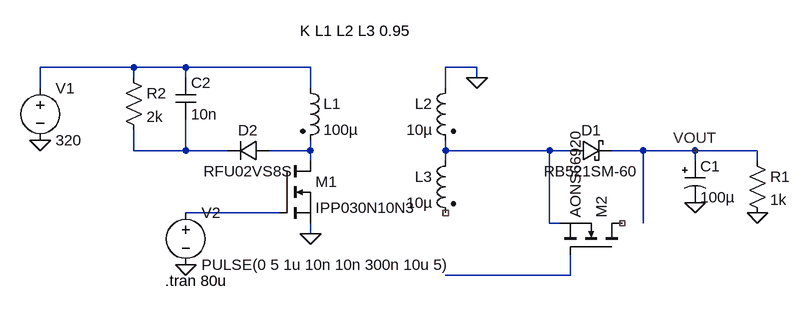
[diagram p0: schematic flyback_secondary_transistor.asc]
flyback_secondary_transistor.asc, the LTspice schematic file:
Version 4
SHEET 1 952 680
WIRE -64 96 -208 96
WIRE 16 96 -64 96
WIRE 208 96 16 96
WIRE 464 96 416 96
WIRE -64 112 -64 96
WIRE 16 112 16 96
WIRE 464 112 464 96
WIRE -208 128 -208 96
WIRE 208 128 208 96
WIRE 416 128 416 96
WIRE -64 224 -64 192
WIRE 16 224 16 176
WIRE 16 224 -64 224
WIRE 80 224 16 224
WIRE 208 224 208 208
WIRE 208 224 144 224
WIRE 416 224 416 208
WIRE 576 224 416 224
WIRE 608 224 576 224
WIRE 720 224 672 224
WIRE 800 224 720 224
WIRE 896 224 800 224
WIRE 208 240 208 224
WIRE 416 240 416 224
WIRE 800 240 800 224
WIRE 896 240 896 224
WIRE 160 320 16 320
WIRE 576 336 576 224
WIRE 592 336 576 336
WIRE 720 336 720 224
WIRE 208 352 208 336
WIRE 608 416 608 384
WIRE 608 416 416 416
FLAG -208 208 0
FLAG 208 352 0
FLAG 16 400 0
FLAG 464 112 0
FLAG 800 304 0
FLAG 800 224 VOUT
FLAG 896 320 0
SYMBOL ind2 192 112 R0
SYMATTR InstName L1
SYMATTR Value 100µ
SYMATTR Type ind
SYMATTR SpiceLine Rser=3
SYMBOL ind2 432 112 M0
SYMATTR InstName L2
SYMATTR Value 10µ
SYMATTR Type ind
SYMATTR SpiceLine Rser=0.1
SYMBOL ind2 432 224 M0
SYMATTR InstName L3
SYMATTR Value 10µ
SYMATTR Type ind
SYMATTR SpiceLine Rser=0.1
SYMBOL voltage -208 112 R0
WINDOW 123 0 0 Left 0
WINDOW 39 0 0 Left 0
SYMATTR InstName V1
SYMATTR Value 320
SYMBOL nmos 160 240 R0
SYMATTR InstName M1
SYMATTR Value IPP030N10N3
SYMBOL voltage 16 304 R0
WINDOW 123 0 0 Left 0
WINDOW 39 0 0 Left 0
SYMATTR InstName V2
SYMATTR Value PULSE(0 5 1u 10n 10n 300n 10u 5)
SYMBOL schottky 608 240 R270
WINDOW 0 32 32 VTop 2
WINDOW 3 0 32 VBottom 2
SYMATTR InstName D1
SYMATTR Value RB521SM-60
SYMATTR Description Diode
SYMATTR Type diode
SYMBOL nmos 688 384 M270
SYMATTR InstName M2
SYMATTR Value AONS66920
SYMBOL polcap 784 240 R0
WINDOW 3 24 56 Left 2
SYMATTR Value 100µ
SYMATTR InstName C1
SYMATTR Description Capacitor
SYMATTR Type cap
SYMATTR SpiceLine V=63 Irms=580m Rser=0.19 Lser=0 mfg="Panasonic" pn="ECA1JFQ101" type="Al electrolytic"
SYMBOL res 880 224 R0
SYMATTR InstName R1
SYMATTR Value 1k
SYMBOL diode 144 208 R90
WINDOW 0 0 32 VBottom 2
WINDOW 3 32 32 VTop 2
SYMATTR InstName D2
SYMATTR Value RFU02VS8S
SYMBOL res -80 96 R0
SYMATTR InstName R2
SYMATTR Value 2k
SYMBOL cap 0 112 R0
SYMATTR InstName C2
SYMATTR Value 10n
TEXT -16 424 Left 2 !.tran 80u
TEXT 192 40 Left 2 !K L1 L2 L3 0.95

The netlist it stands for:
* flyback_secondary_transistor.asc
L1 N001 N003 100µ Rser=3
L2 0 N004 10µ Rser=0.1
L3 N004 NC_01 10µ Rser=0.1
V1 N001 0 320
M1 N003 N005 0 0 IPP030N10N3
V2 N005 0 PULSE(0 5 1u 10n 10n 300n 10u 5)
D1 N004 VOUT RB521SM-60
M2 NC_02 N006 N004 N004 AONS66920
C1 VOUT 0 100µ V=63 Irms=580m Rser=0.19 Lser=0 mfg="Panasonic" pn="ECA1JFQ101" type="Al electrolytic"
R1 VOUT 0 1k
D2 N003 N002 RFU02VS8S
R2 N001 N002 2k
C2 N001 N002 10n
.model D D
.lib standard.dio
.model NMOS NMOS
.model PMOS PMOS
.lib standard.mos
.tran 80u
K L1 L2 L3 0.95
.backanno
.end